# Altium schematic sheet MOSFET-Motor-Sheet-3.SchDoc
size 420 x 297 mm; SheetNumber: 11; SheetTotal: 15
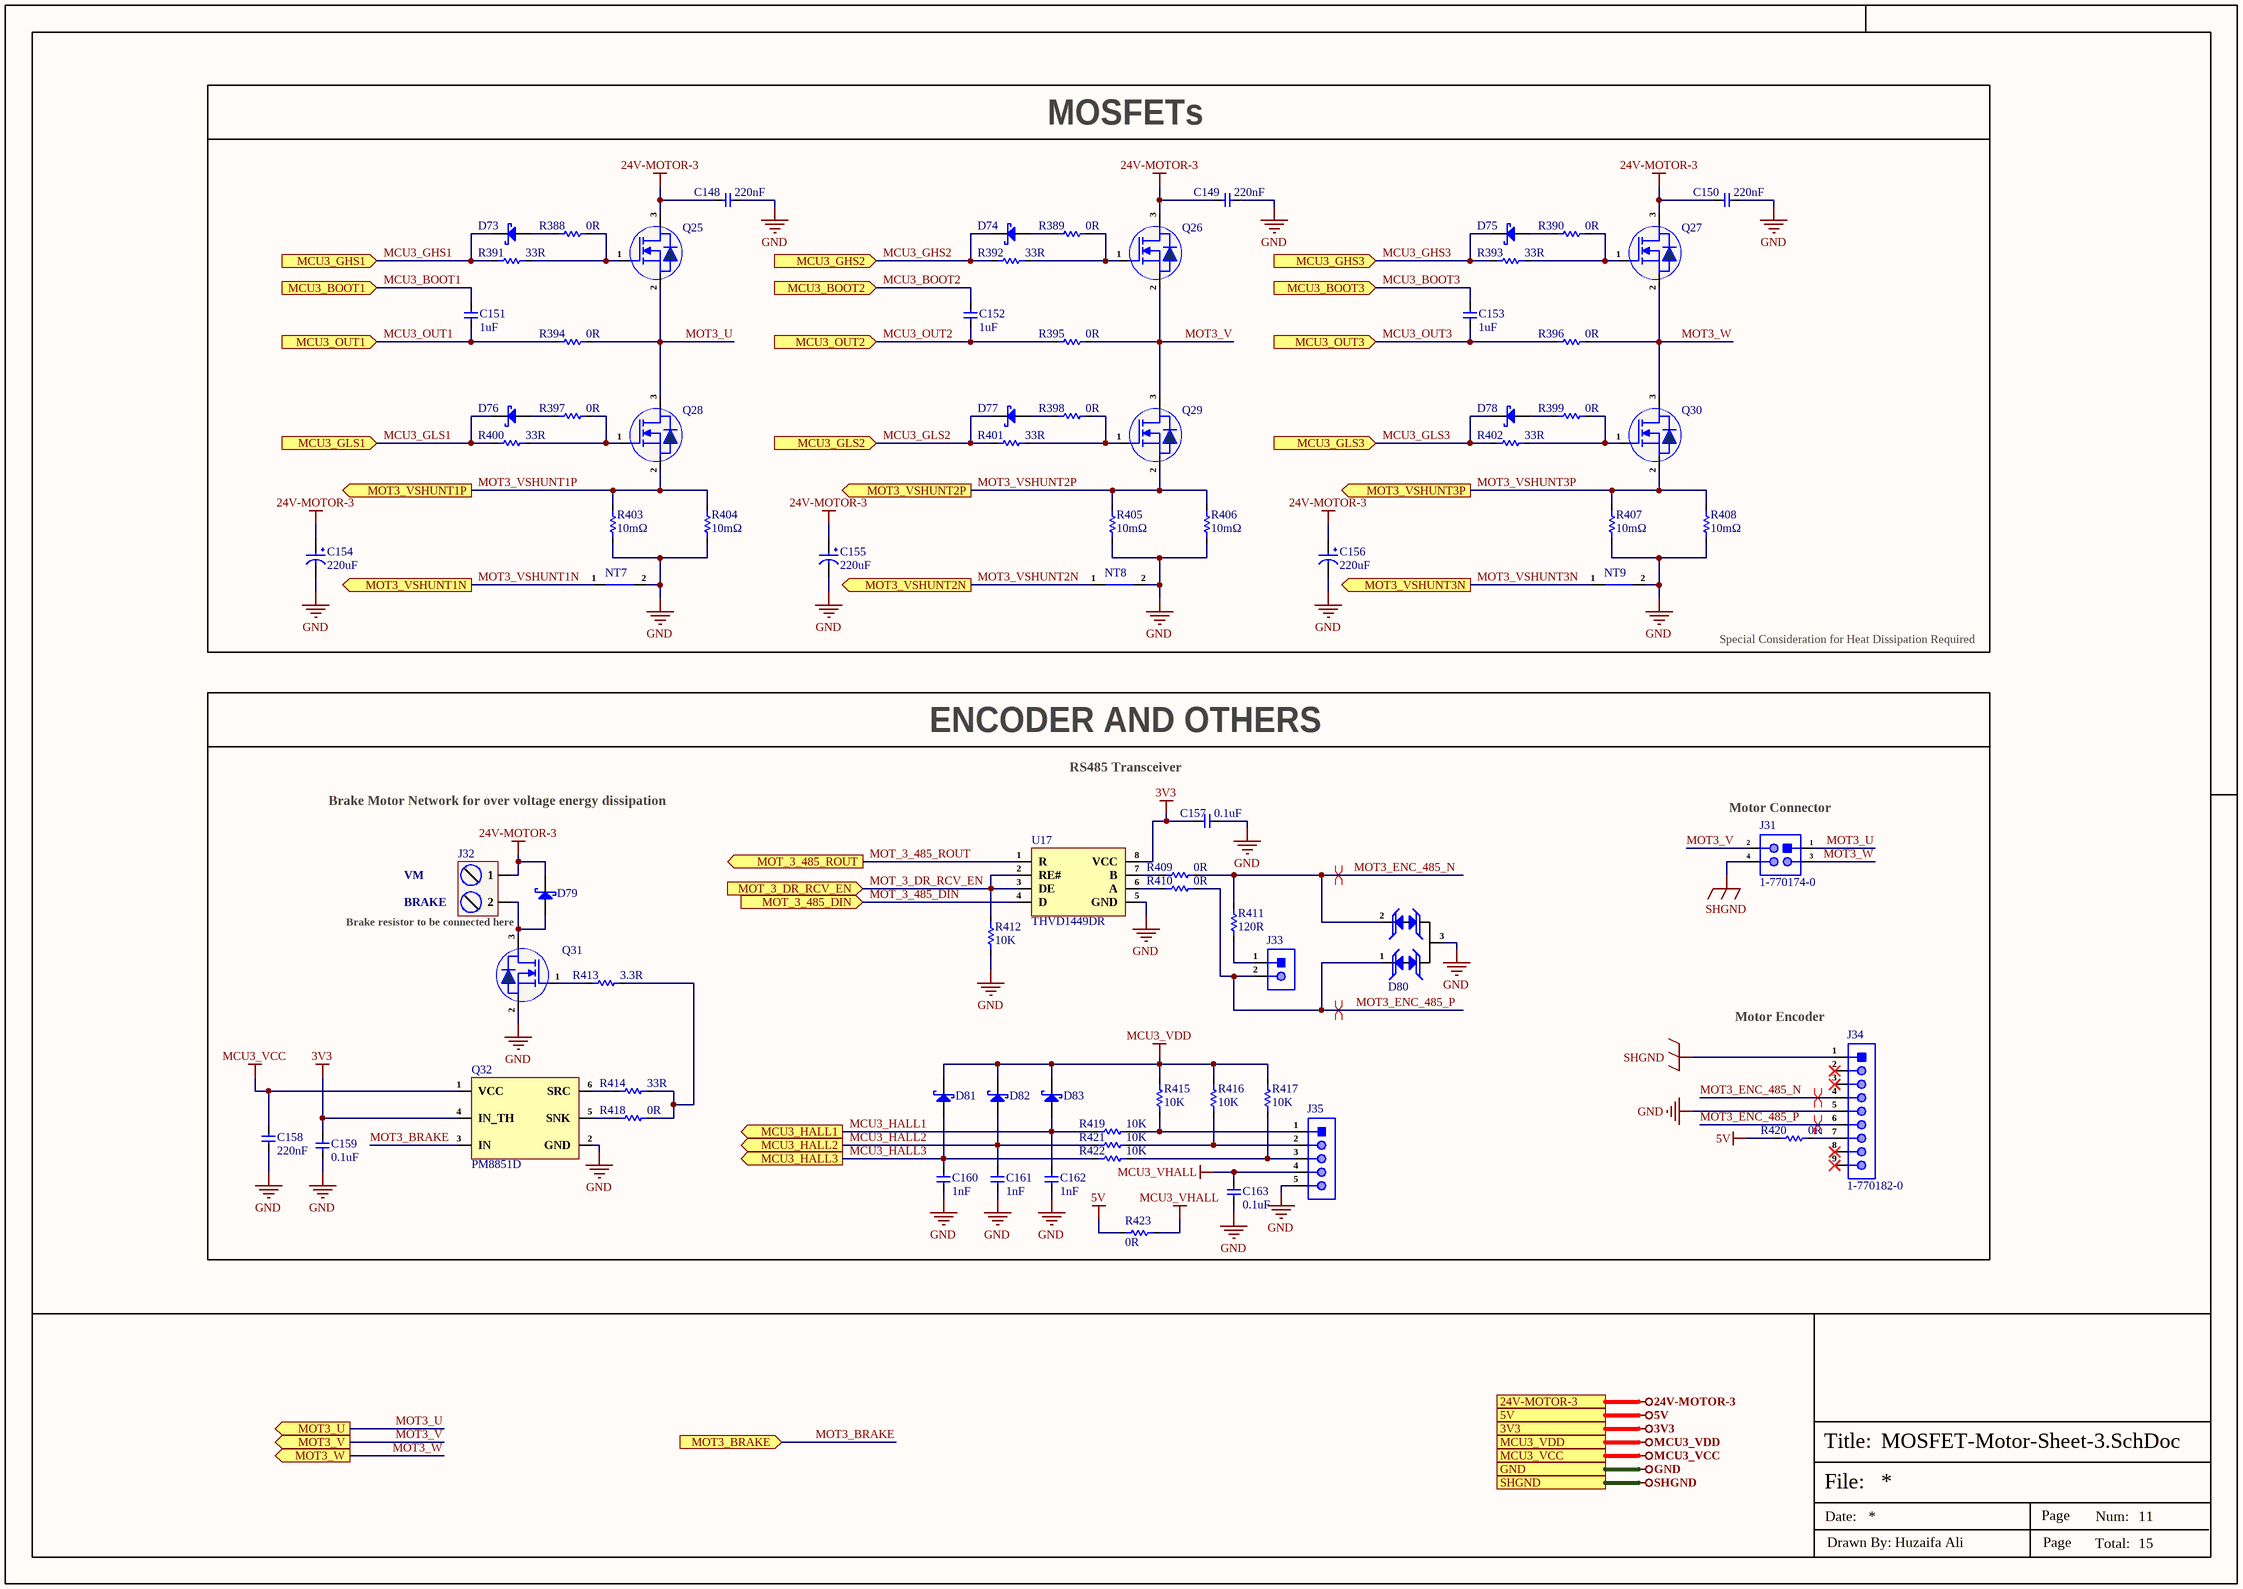
[diagram p0: MOSFET-Motor-Sheet-3.SchDoc]

## Parts
C148  220nF  [Cap-0805]
C149  220nF  [Cap-0805]
C150  220nF  [Cap-0805]
C151  1uF  [Cap-0603]
C152  1uF  [Cap-0603]
C153  1uF  [Cap-0603]
C154  220uF  [SPE1VM221E12OL]
C155  220uF  [SPE1VM221E12OL]
C156  220uF  [SPE1VM221E12OL]
C157  0.1uF  [Cap-0402]
C158  220nF  [Cap-0402]
C159  0.1uF  [Cap-0402]
C160  1nF  [Cap-0402]
C161  1nF  [Cap-0402]
C162  1nF  [Cap-0402]
C163  0.1uF  [Cap-0402]
D73  BAT48JFILM  [SOD-323]  (value not drawn)
D74  BAT48JFILM  [SOD-323]  (value not drawn)
D75  BAT48JFILM  [SOD-323]  (value not drawn)
D76  BAT48JFILM  [SOD-323]  (value not drawn)
D77  BAT48JFILM  [SOD-323]  (value not drawn)
D78  BAT48JFILM  [SOD-323]  (value not drawn)
D79  STPS3H100UF  [SMB_]  (value not drawn)
D80  SM712  [SOT-23]  (value not drawn)
D81  BAT30KFILM  [SOD-523]  (value not drawn)
D82  BAT30KFILM  [SOD-523]  (value not drawn)
D83  BAT30KFILM  [SOD-523]  (value not drawn)
J31  1-770174-0  [1-770174-0]
J32  DB128L-5.08-2P-BK-S  [DB128L-5.08-2P-BK-S]  (value not drawn)
J33  X6511WV-02H-C60D30  [HDR1X2_]  (value not drawn)
J34  1-770182-0  [1-770182-0]
J35  X6511WV-05H-C60D30  [HDR1X5_]  (value not drawn)
NT7  Net Tie_SMD  [Net Tie Pad]  (value not drawn)  (net tie, no BOM)
NT8  Net Tie_SMD  [Net Tie Pad]  (value not drawn)  (net tie, no BOM)
NT9  Net Tie_SMD  [Net Tie Pad]  (value not drawn)  (net tie, no BOM)
Q25  STH240N10F7-2  [H2PAK-2]  (value not drawn)
Q26  STH240N10F7-2  [H2PAK-2]  (value not drawn)
Q27  STH240N10F7-2  [H2PAK-2]  (value not drawn)
Q28  STH240N10F7-2  [H2PAK-2]  (value not drawn)
Q29  STH240N10F7-2  [H2PAK-2]  (value not drawn)
Q30  STH240N10F7-2  [H2PAK-2]  (value not drawn)
Q31  STH240N10F7-2  [H2PAK-2]  (value not drawn)
Q32  PM8851D  [SOT-23-6]
R388  0R  [Res-0805]
R389  0R  [Res-0805]
R390  0R  [Res-0805]
R391  33R  [Res-0402]
R392  33R  [Res-0402]
R393  33R  [Res-0402]
R394  0R  [Res-0805]
R395  0R  [Res-0805]
R396  0R  [Res-0805]
R397  0R  [Res-0805]
R398  0R  [Res-0805]
R399  0R  [Res-0805]
R400  33R  [Res-0402]
R401  33R  [Res-0402]
R402  33R  [Res-0402]
R403  10mΩ  [RES-2512]
R404  10mΩ  [RES-2512]
R405  10mΩ  [RES-2512]
R406  10mΩ  [RES-2512]
R407  10mΩ  [RES-2512]
R408  10mΩ  [RES-2512]
R409  0R  [Res-0402]
R410  0R  [Res-0402]
R411  120R  [Res-0603]
R412  10K  [Res-0402]
R413  3.3R  [Res-0402]
R414  33R  [Res-0402]
R415  10K  [Res-0402]
R416  10K  [Res-0402]
R417  10K  [Res-0402]
R418  0R  [Res-0805]
R419  10K  [Res-0402]
R420  0R  [Res-0402]
R421  10K  [Res-0402]
R422  10K  [Res-0402]
R423  0R  [Res-0805]
U17  THVD1449DR  [SOIC-8(0.154", 3.90mm Width)]

## Blocks framed on the sheet
MOSFETs: C148-C156 D73-D78 NT7-NT9 Q25-Q30 R388-R408
ENCODER AND OTHERS: C157-C163 D79-D83 J31-J35 Q31 Q32 R409-R423 U17

## Ports
3V3, 5V, 24V-MOTOR-3, GND, MCU3_BOOT1 (in), MCU3_BOOT2 (in), MCU3_BOOT3 (in), MCU3_GHS1 (in), MCU3_GHS2 (in), MCU3_GHS3 (in), MCU3_GLS1 (in), MCU3_GLS2 (in), MCU3_GLS3 (in), MCU3_HALL1 (out), MCU3_HALL2 (out), MCU3_HALL3 (out), MCU3_OUT1 (in), MCU3_OUT2 (in), MCU3_OUT3 (in), MCU3_VCC, MCU3_VDD, MOT3_BRAKE (in), MOT3_U (out), MOT3_V (out), MOT3_VSHUNT1N (out), MOT3_VSHUNT1P (out), MOT3_VSHUNT2N (out), MOT3_VSHUNT2P (out), MOT3_VSHUNT3N (out), MOT3_VSHUNT3P (out), MOT3_W (out), MOT_3_485_DIN (in), MOT_3_485_ROUT (out), MOT_3_DR_RCV_EN (in), SHGND

## Nets
3V3: C157.2 C159.2 Q32.4(IN_TH) U17.8(VCC) ; port 3V3
5V: R420.1 R423.1 ; port 5V
24V-MOTOR-3: C148.2 C149.2 C150.2 C154.1 C155.1 C156.1 D79.2(K) J32.1 Q25.3(D) Q26.3(D) Q27.3(D) ; port 24V-MOTOR-3
GND: C148.1 C149.1 C150.1 C154.2 C155.2 C156.2 C157.1 C158.1 C159.1 C160.1 C161.1 C162.1 C163.2 D80.3(GND) J34.5 J35.5 NT7.2 NT8.2 NT9.2 Q31.2(S) Q32.2(GND) R403.1 R404.1 R405.1 R406.1 R407.1 R408.1 R412.2 U17.5(GND) ; port GND
MCU3_VCC: C158.2 Q32.1(VCC) ; port MCU3_VCC
MCU3_VDD: D81.2(K) D82.2(K) D83.2(K) R415.2 R416.2 R417.2 ; port MCU3_VDD
MCU3_VHALL: C163.1 J35.4 R423.2
SHGND: J31.4 J34.1 ; port SHGND
MCU3_BOOT1: C151.2 ; port MCU3_BOOT1
MCU3_BOOT2: C152.2 ; port MCU3_BOOT2
MCU3_BOOT3: C153.2 ; port MCU3_BOOT3
MCU3_GHS1: D73.1(K) R391.1 ; port MCU3_GHS1
MCU3_GHS2: D74.1(K) R392.1 ; port MCU3_GHS2
MCU3_GHS3: D75.1(K) R393.1 ; port MCU3_GHS3
MCU3_GLS1: D76.1(K) R400.1 ; port MCU3_GLS1
MCU3_GLS2: D77.1(K) R401.1 ; port MCU3_GLS2
MCU3_GLS3: D78.1(K) R402.1 ; port MCU3_GLS3
MCU3_HALL1: C162.2 D83.1(A) R419.1 ; port MCU3_HALL1
MCU3_HALL2: C161.2 D82.1(A) R421.1 ; port MCU3_HALL2
MCU3_HALL3: C160.2 D81.1(A) R422.1 ; port MCU3_HALL3
MCU3_OUT1: C151.1 R394.1 ; port MCU3_OUT1
MCU3_OUT2: C152.1 R395.1 ; port MCU3_OUT2
MCU3_OUT3: C153.1 R396.1 ; port MCU3_OUT3
MOT3_BRAKE: Q32.3(IN) ; port MOT3_BRAKE
MOT3_ENC_485_N: D80.2(I/O2) J34.4 R409.2 R411.2
MOT3_ENC_485_P: D80.1(I/O1) J33.2 J34.6 R410.2
MOT3_U: J31.1 Q25.2(S) Q28.3(D) R394.2 ; port MOT3_U
MOT3_V: J31.2 Q26.2(S) Q29.3(D) R395.2 ; port MOT3_V
MOT3_VSHUNT1N: NT7.1 ; port MOT3_VSHUNT1N
MOT3_VSHUNT1P: Q28.2(S) R403.2 R404.2 ; port MOT3_VSHUNT1P
MOT3_VSHUNT2N: NT8.1 ; port MOT3_VSHUNT2N
MOT3_VSHUNT2P: Q29.2(S) R405.2 R406.2 ; port MOT3_VSHUNT2P
MOT3_VSHUNT3N: NT9.1 ; port MOT3_VSHUNT3N
MOT3_VSHUNT3P: Q30.2(S) R407.2 R408.2 ; port MOT3_VSHUNT3P
MOT3_W: J31.3 Q27.2(S) Q30.3(D) R396.2 ; port MOT3_W
MOT_3_485_DIN: U17.4(D) ; port MOT_3_485_DIN
MOT_3_485_ROUT: U17.1(R) ; port MOT_3_485_ROUT
MOT_3_DR_RCV_EN: R412.1 U17.2(RE#) U17.3(DE) ; port MOT_3_DR_RCV_EN
NetD73_2: D73.2(A) R388.1
NetD74_2: D74.2(A) R389.1
NetD75_2: D75.2(A) R390.1
NetD76_2: D76.2(A) R397.1
NetD77_2: D77.2(A) R398.1
NetD78_2: D78.2(A) R399.1
NetD79_1: D79.1(A) J32.2 Q31.3(D)
NetJ33_1: J33.1 R411.1
NetJ34_7: J34.7 R420.2
NetJ35_1: J35.1 R415.1 R419.2
NetJ35_2: J35.2 R416.1 R421.2
NetJ35_3: J35.3 R417.1 R422.2
NetQ25_1: Q25.1(G) R388.2 R391.2
NetQ26_1: Q26.1(G) R389.2 R392.2
NetQ27_1: Q27.1(G) R390.2 R393.2
NetQ28_1: Q28.1(G) R397.2 R400.2
NetQ29_1: Q29.1(G) R398.2 R401.2
NetQ30_1: Q30.1(G) R399.2 R402.2
NetQ31_1: Q31.1(G) R413.1
NetQ32_5: Q32.5(SNK) R418.1
NetQ32_6: Q32.6(SRC) R414.1
NetR409_1: R409.1 U17.7(B)
NetR410_1: R410.1 U17.6(A)
NetR413_2: R413.2 R414.2 R418.2

Not connected (* = marked no-connect by the designer): J34 2* 3* 8* 9*

## Layout directives
differential pair: MOT3_ENC_485_N, MOT3_ENC_485_P
differential pair; differential pair class DIFF_RS485: MOT3_ENC_485_N, MOT3_ENC_485_P

## Notes on the sheet
- Special Consideration for Heat Dissipation Required
- Brake Motor Network for over voltage energy dissipation
- (near C157) RS485 Transceiver
- (near J31) Motor Connector
- VM
- BRAKE
- Brake resistor to be connected here
- (near J34) Motor Encoder
- File:
- Title:
- Date:
- Page
- Num:
- Total:
- Drawn By: Huzaifa Ali

## Library data of the parts
C148-C150 = CC0805KKX7R0BB224: CAP CER 0.22UF 100V X7R 0805; Manufacturer: Yageo; Item Type: Capacitor; Tolerance: 10%; Supplier: Future Electronics; LCSC Part Number: C513710; Manufacturer Part Number: CC0805KKX7R0BB224; RoHS: Yes; Stock: 123000; Pricing: 3000=0.0385, 9000=0.0376, 15000=0.0372, 60000=0.0361, 90000=0.0353 (USD); Mounting Technology: Surface Mount; Case/Package: 0805; Case Code (Metric): 2012; Case Code (Imperial): 0805; Weight: 0.000194oz; Min Operating Temperature: -55°C; Max Operating Temperature: 125°C; Packaging: Tape and Reel; Value: 220nF; Voltage Rating: 100V; Dielectric: X7R; Termination: SMD/SMT; Voltage Rating (DC): 100V; Package Quantity: 3000; Series: CC; Length: 2mm; Width: 1.25mm; RoHS Compliant: Yes; ComponentLink1URL: https://media.digikey.com/pdf/Data%20Sheets/Yageo%20PDFs/NPO,%20X7R%20Mid-voltage.pdf?src-supplier=Digikey; ComponentLink1Description: https://media.digikey.com/pdf/Data%20Sheets/Yageo%20PDFs/NPO,%20X7R%20Mid-voltage.pdf?src-supplier=Digikey; ComponentLink2URL: http://www.mouser.com/ds/2/447/Yageo_UPY-GP_NP0_16V-to-50V_9-358835.pdf?src-supplier=Mouser; ComponentLink2Description: http://www.mouser.com/ds/2/447/Yageo_UPY-GP_NP0_16V-to-50V_9-358835.pdf?src-supplier=Mouser; ComponentLink3URL: https://datasheet.octopart.com/CC0805KKX7R0BB224-Yageo-datasheet-137700083.pdf?src-supplier=Future+Electronics; ComponentLink3Description: https://datasheet.octopart.com/CC0805KKX7R0BB224-Yageo-datasheet-137700083.pdf?src-supplier=Future+Electronics; ComponentLink4URL: http://www.yageo.com/documents/recent/UPY-NP0X7R_MV_100-to-630V_21.pdf?src-supplier=Digikey; ComponentLink4Description: http://www.yageo.com/documents/recent/UPY-NP0X7R_MV_100-to-630V_21.pdf?src-supplier=Digikey; ComponentLink5URL: https://datasheet.octopart.com/CC0805KKX7R0BB224-Yageo-datasheet-166511530.pdf?src-supplier=Future+Electronics; ComponentLink5Description: https://datasheet.octopart.com/CC0805KKX7R0BB224-Yageo-datasheet-166511530.pdf?src-supplier=Future+Electronics; ComponentLink6URL: https://datasheet.octopart.com/CC0805KKX7R0BB224-Yageo-datasheet-101324229.pdf?src-supplier=Newark; ComponentLink6Description: https://datasheet.octopart.com/CC0805KKX7R0BB224-Yageo-datasheet-101324229.pdf?src-supplier=Newark
C151-C153 = CL10A105KB8NNNC: CAP CER 1UF 50V X5R 0603; Manufacturer: Samsung; Material: 4241ConductorMaterial; Tolerance: 10%; Item Type: Capacitor; Supplier: Avnet; Supplier Part Number: CL10A105KB8NNNC; Manufacturer Part Number: CL10A105KB8NNNC; RoHS: Yes; Category: Ceramic Capacitors; Stock: 780446; Pricing: 4000=0.01632, 8000=0.01595, 16000=0.01557, 24000=0.0152, 32000=0.01482 (USD); Mounting Technology: Surface Mount; Case/Package: 0603; Case Code (Metric): 1608; Case Code (Imperial): 0603; Min Operating Temperature: -55°C; Max Operating Temperature: 85°C; Packaging: Tape and Reel; Value: 1uF; Voltage Rating: 50V; Dielectric: X5R; Series: CL; Voltage Rating (DC): 50V; Length: 1.6mm; Depth: 0.8mm; Radiation Hardening: No; RoHS Compliant: Yes; ComponentLink1URL: https://datasheet.ciiva.com/26877/getdatasheetpartid-753736-26877879.pdf?src-supplier=Verical; ComponentLink1Description: https://datasheet.ciiva.com/26877/getdatasheetpartid-753736-26877879.pdf?src-supplier=Verical; LCSC Part Number: C15849
C154-C156 = SPE1VM221E12OL: 35V 220uF ±20% Plugin,D6.3xL12mm Polymer Aluminum Capacitors ROHS; Manufacturer: Yunxing; Manufacturer Part Number: SPE1VM221E12OL; Package: Plugin,D6.3xL12mm; LCSC Part Number: C698133; Item Type: Capacitor; ComponentLink1Description: LCSC; ComponentLink1URL: https://www.lcsc.com/product-detail/Polymer-Aluminum-Capacitors_Yunxing-SPE1VM221E12OL_C698133.html?s_z=n_SPE1VM221E12OL
C157 C159 C163 = CC0402JRX7R7BB104: CAP CER 0.1UF 16V X7R 0402; Manufacturer: Yageo; Material: 4241ConductorMaterial; Value: 100nF; Tolerance: 5%; Item Type: Capacitor; Supplier: Digikey; Supplier Part Number: 311-1676-1-ND; Manufacturer Part Number: CC0402JRX7R7BB104; RoHS: Yes; Category: Ceramic Capacitors; Stock: 1659111; Pricing: 1=0.1, 10=0.046, 50=0.0262, 100=0.0203, 500=0.01528, 1000=0.012, 2500=0.01091, 5000=0.01004 (USD); Mounting Technology: Surface Mount; Case/Package: 0402; Case Code (Metric): 1005; Case Code (Imperial): 0402; Min Operating Temperature: -55°C; Max Operating Temperature: 125°C; Dielectric: X7R; Packaging: Tape and Reel; Package Quantity: 10000; Voltage Rating (DC): 16V; Voltage Rating: 16V; Series: CC; Construction: Flat; Length: 0.039inch; Width: 0.02inch; Height: 0.5mm; Thickness: 0.022inch; Lead Free: Lead Free; Halogen Free: Halogen Free; RoHS Compliant: Yes; ComponentLink1URL: https://datasheet.ciiva.com/13210/upy-gphc-x7r-6-3v-to-50v-8-12304-13210152.pdf?src-supplier=Mouser; ComponentLink1Description: https://datasheet.ciiva.com/13210/upy-gphc-x7r-6-3v-to-50v-8-12304-13210152.pdf?src-supplier=Mouser; LCSC Part Number: C541464
C158 = CC0402KRX5R8BB224: CAP CER 0.22UF 25V X5R 0402; Manufacturer: Yageo; Item Type: Capacitors; Tolerance: 10%; Supplier 1: Mouser; Manufacturer Part Number: CC0402KRX5R8BB224; RoHS: Yes; Stock 1: 61266; Pricing 1: 1=0.10000, 10=0.03300, 50=0.03300, 100=0.02700, 1000=0.01500, 10000=0.01300 (USD); Mount: Surface Mount; Case/Package: 0402; Min Operating Temperature: -55°C; Max Operating Temperature: 85°C; Packaging: Tape and Reel; Capacitance: 220nF; Voltage Rating: 25V; Voltage Rating (DC): 25V; Dielectric: X5R; Length: 0.039inch; Width: 0.02inch; Thickness: 0.022inch; Lead Free: Lead Free; Halogen Free: Halogen Free; RoHS Compliant: Yes; ComponentLink1URL: http://www.yageo.com/documents/recent/UPY-GPHC_X5R_4V-to-50V_25.pdf?src-supplier=Digi-Key; ComponentLink1Description: http://www.yageo.com/documents/recent/UPY-GPHC_X5R_4V-to-50V_25.pdf?src-supplier=Digi-Key; ComponentLink2URL: https://www.yageo.com/upload/media/product/productsearch/datasheet/mlcc/UPY-GPHC_X5R_4V-to-50V_26.pdf?src-supplier=Digi-Key; ComponentLink2Description: https://www.yageo.com/upload/media/product/productsearch/datasheet/mlcc/UPY-GPHC_X5R_4V-to-50V_26.pdf?src-supplier=Digi-Key; ComponentLink3URL: http://www.yageo.com/documents/recent/UPY-GPHC_X5R_4V-to-50V_23.pdf?src-supplier=Digi-Key; ComponentLink3Description: http://www.yageo.com/documents/recent/UPY-GPHC_X5R_4V-to-50V_23.pdf?src-supplier=Digi-Key; Supplier Part Number 1: 603-CC402KRX5R8BB224; LCSC Part Number: C326836
C160-C162 = CC0402KRX7R8BB102: CAP CER 1000PF 25V X7R 0402; Manufacturer: Yageo; Tolerance: 10%; Dissipation Factor: 2.5%; Insulation Resistance: 10GR; Item Type: Capacitor; Supplier 1: Arrow Electronics; Manufacturer Part Number: CC0402KRX7R8BB102; RoHS: Yes; Category: Ceramic Capacitors; Stock 1: 370000; Pricing 1: 1=0.00230, 10000=0.00230, 100001=0.00190 (USD); Mount: Surface Mount; Case/Package: 0402; Number of Pins: 2; Case Code (Imperial): 0402; Case Code (Metric): 1005; Min Operating Temperature: -55°C; Max Operating Temperature: 125°C; Capacitance: 1nF; Packaging: Tape and Reel; Voltage Rating: 25V; Dielectric: X7R; Termination: SMD/SMT; Voltage Rating (DC): 25V; Series: CC; Length: 1mm; Width: 0.02inch; Thickness: 0.022inch; Depth: 0.5mm; Radiation Hardening: No; Lead Free: Lead Free; Halogen Free: Halogen Free; RoHS Compliant: Yes; ComponentLink1URL: https://datasheet.ciiva.com/26862/getdatasheetpartid-639817-26862638.pdf?src-supplier=Verical; ComponentLink1Description: https://datasheet.ciiva.com/26862/getdatasheetpartid-639817-26862638.pdf?src-supplier=Verical; ComponentLink2URL: https://datasheet.ciiva.com/5425/upy-gp-np0-16v-to-50v-8-3714-5425527.pdf?src-supplier=Mouser; ComponentLink2Description: https://datasheet.ciiva.com/5425/upy-gp-np0-16v-to-50v-8-3714-5425527.pdf?src-supplier=Mouser; Supplier Part Number 1: CC0402KRX7R8BB102; LCSC Part Number: C541372
D73-D78 = BAT48JFILM: DIODE SCHOTTKY 40V 350MA SOD323; Manufacturer: STMicroelectronics; Supplier: Future Electronics; LCSC Part Number: C2798199; Manufacturer Part Number: BAT48JFILM; RoHS: Yes; Item Type: Diode; Stock: 21000; Pricing: 3000=0.0329, 9000=0.0316, 15000=0.031, 30000=0.0303, 60000=0.0291 (USD); ComponentLink1URL: https://datasheet.ciiva.com/23920/1449576-23920129.pdf?src-supplier=Newark; ComponentLink1Description: https://datasheet.ciiva.com/23920/1449576-23920129.pdf?src-supplier=Newark; ComponentLink2URL: https://datasheet.ciiva.com/4714/cd00130229-113731-4714649.pdf?src-supplier=Mouser; ComponentLink2Description: https://datasheet.ciiva.com/4714/cd00130229-113731-4714649.pdf?src-supplier=Mouser; ComponentLink3URL: https://datasheet.ciiva.com/915/cd00130229-915689.pdf?src-supplier=Digikey; ComponentLink3Description: https://datasheet.ciiva.com/915/cd00130229-915689.pdf?src-supplier=Digikey; ComponentLink4URL: https://datasheet.ciiva.com/915/cd00130229-915690.pdf?src-supplier=Digikey; ComponentLink4Description: https://datasheet.ciiva.com/915/cd00130229-915690.pdf?src-supplier=Digikey; ComponentLink5URL: https://datasheet.ciiva.com/915/cd00130229-915691.pdf?src-supplier=Digikey; ComponentLink5Description: https://datasheet.ciiva.com/915/cd00130229-915691.pdf?src-supplier=Digikey; ComponentLink6URL: https://datasheet.ciiva.com/16206/cd00130229-16206668.pdf?src-supplier=Future+Electronics; ComponentLink6Description: https://datasheet.ciiva.com/16206/cd00130229-16206668.pdf?src-supplier=Future+Electronics
D79 = STPS3H100UF: DIODE SCHOTTKY 100V 3A SMBFLAT; Manufacturer: STMicroelectronics; Supplier: Mouser; LCSC Part Number: C155643; Manufacturer Part Number: STPS3H100UF; RoHS: Yes; Item Type: Diode; Stock: 122842; Pricing: 1=0.35, 10=0.257, 50=0.257, 100=0.213, 1000=0.143, 10000=0.103 (USD); Lead Free: 5697LeadFree; RoHS Compliant: 5897YesNo; ComponentLink1URL: https://datasheet.ciiva.com/4716/cd00256107-65241-4716262.pdf?src-supplier=Mouser; ComponentLink1Description: https://datasheet.ciiva.com/4716/cd00256107-65241-4716262.pdf?src-supplier=Mouser; ComponentLink2URL: https://datasheet.ciiva.com/915/cd00256107-915837.pdf?src-supplier=Digikey; ComponentLink2Description: https://datasheet.ciiva.com/915/cd00256107-915837.pdf?src-supplier=Digikey; ComponentLink3URL: https://datasheet.ciiva.com/915/cd00256107-915838.pdf?src-supplier=Digikey; ComponentLink3Description: https://datasheet.ciiva.com/915/cd00256107-915838.pdf?src-supplier=Digikey; ComponentLink4URL: https://datasheet.ciiva.com/915/cd00256107-915839.pdf?src-supplier=Digikey; ComponentLink4Description: https://datasheet.ciiva.com/915/cd00256107-915839.pdf?src-supplier=Digikey; ComponentLink5URL: https://datasheet.ciiva.com/16491/cd00256107-16491518.pdf?src-supplier=Future+Electronics; ComponentLink5Description: https://datasheet.ciiva.com/16491/cd00256107-16491518.pdf?src-supplier=Future+Electronics
D80 = SM712: SOT-23 TVS ROHS; Manufacturer: TECH PUBLIC; Item Type: Diode; Manufacturer Part Number: SM712; Package: SOT-23; LCSC Part Number: C521963; ComponentLink1Description: LCSC; ComponentLink1URL: https://www.lcsc.com/product-detail/TVS_TECH-PUBLIC-SM712_C521963.html
D81-D83 = BAT30KFILM: DIODE SCHOTTKY 30V 300MA SOD523; Manufacturer: STMicroelectronics; Supplier: Digikey; LCSC Part Number: C2926449; Manufacturer Part Number: BAT30KFILM; RoHS: Yes; Item Type: Diode; Stock: 129643; Pricing: 1=0.33, 10=0.204, 100=0.1279, 500=0.09468, 1000=0.08393 (USD); ComponentLink1URL: https://datasheet.ciiva.com/15192/getdatasheetpartid-146449-15192970.pdf?src-supplier=Verical; ComponentLink1Description: https://datasheet.ciiva.com/15192/getdatasheetpartid-146449-15192970.pdf?src-supplier=Verical; ComponentLink2URL: https://datasheet.ciiva.com/16418/cd00126118-16418392.pdf?src-supplier=Future+Electronics; ComponentLink2Description: https://datasheet.ciiva.com/16418/cd00126118-16418392.pdf?src-supplier=Future+Electronics; ComponentLink3URL: https://datasheet.ciiva.com/915/cd00126118-915601.pdf?src-supplier=Digikey; ComponentLink3Description: https://datasheet.ciiva.com/915/cd00126118-915601.pdf?src-supplier=Digikey; ComponentLink4URL: https://datasheet.ciiva.com/915/cd00126118-915602.pdf?src-supplier=Digikey; ComponentLink4Description: https://datasheet.ciiva.com/915/cd00126118-915602.pdf?src-supplier=Digikey; ComponentLink5URL: https://datasheet.ciiva.com/915/cd00126118-915603.pdf?src-supplier=Digikey; ComponentLink5Description: https://datasheet.ciiva.com/915/cd00126118-915603.pdf?src-supplier=Digikey
J31 = 1-770174-0: CONN HEADER VERT 4POS 4.14MM; Manufacturer: TE Connectivity; Item Type: Power Connectors; Supplier: Future Electronics; Supplier Part Number: 3310547; Manufacturer Part Number: 1-770174-0; RoHS: Yes; Stock: 890; Pricing: 1=0.995, 30=1.04, 40=0.945, 125=0.91, 300=0.95, 400=0.87, 1250=0.8 (USD); ComponentLink1URL: https://datasheet.ciiva.com/19460/746478-19460823.pdf?src-supplier=Jameco; ComponentLink1Description: https://datasheet.ciiva.com/19460/746478-19460823.pdf?src-supplier=Jameco; ComponentLink2URL: https://datasheet.ciiva.com/11755/0900766b80b8608c-11755178.pdf?src-supplier=Rs; ComponentLink2Description: https://datasheet.ciiva.com/11755/0900766b80b8608c-11755178.pdf?src-supplier=Rs; ComponentLink3URL: https://datasheet.ciiva.com/16324/eng-cs-82181-softshell-high-density-0508-16324224.pdf?src-supplier=Future+Electronics; ComponentLink3Description: https://datasheet.ciiva.com/16324/eng-cs-82181-softshell-high-density-0508-16324224.pdf?src-supplier=Future+Electronics; ComponentLink4URL: https://datasheet.ciiva.com/1111/eng-cd-770174-l2-1111782.pdf?src-supplier=Element14; ComponentLink4Description: https://datasheet.ciiva.com/1111/eng-cd-770174-l2-1111782.pdf?src-supplier=Element14; ComponentLink5URL: https://datasheet.ciiva.com/15173/getdatasheetpartid-47574-15173655.pdf?src-supplier=Verical; ComponentLink5Description: https://datasheet.ciiva.com/15173/getdatasheetpartid-47574-15173655.pdf?src-supplier=Verical; ComponentLink6URL: https://datasheet.ciiva.com/710/eng-cd-770174-m-710026.pdf?src-supplier=Digikey; ComponentLink6Description: https://datasheet.ciiva.com/710/eng-cd-770174-m-710026.pdf?src-supplier=Digikey; ComponentLink7URL: https://datasheet.ciiva.com/3126/eng-cs-82181-softshell-high-density-0408-3126092.pdf?src-supplier=Avnet; ComponentLink7Description: https://datasheet.ciiva.com/3126/eng-cs-82181-softshell-high-density-0408-3126092.pdf?src-supplier=Avnet; ComponentLink8URL: https://datasheet.ciiva.com/30189/eng-cs-82181-softshell-high-density-0508-30189644.pdf?src-supplier=Onlinecomponents.com; ComponentLink8Description: https://datasheet.ciiva.com/30189/eng-cs-82181-softshell-high-density-0508-30189644.pdf?src-supplier=Onlinecomponents.com; ComponentLink9URL: https://datasheet.ciiva.com/29266/745091-da-01-en-4-pol-mini-univ-mate-n-lok-stecksockel-29266107.pdf?src-supplier=Conrad; ComponentLink9Description: https://datasheet.ciiva.com/29266/745091-da-01-en-4-pol-mini-univ-mate-n-lok-stecksockel-29266107.pdf?src-supplier=Conrad
J32 = DB128L-5.08-2P-BK-S: 1x2P 18A -40℃~+105℃ 250V Black 12~30 Straight pin 5.08mm 2.5 1 2 Plugin,P=5.08mm Screw terminal ROHS; Manufacturer: DIBO; Item Type: Terminal Block; Manufacturer Part Number: DB128L-5.08-2P-BK-S; Package: Plugin,P=5.08mm; LCSC Part Number: C430601; ComponentLink1Description: LCSC; ComponentLink1URL: https://www.lcsc.com/product-detail/Screw-terminal_span-style-background-color-ff0-DIBO-span-DB128L-5-08-2P-BK-S_C430601.html
J33 = X6511WV-02H-C60D30: Gold 250V 3A Straight Square Pins 2.5mm 2P 260℃ 6mm -40℃~+105℃ 3mm 2.54mm Plugin Black Brass 1x2P Plugin,P=2.54mm Pin Headers ROHS; Manufacturer: XKB; Item Type: Male Header; Manufacturer Part Number: X6511WV-02H-C60D30; Package: Plugin,P=2.54mm; LCSC Part Number: C706874; ComponentLink1Description: LCSC; ComponentLink1URL: https://www.lcsc.com/product-detail/Pin-Headers_XKB-Connectivity-X6511WV-02H-C60D30_C706874.html
J34 = 1-770182-0: CONN HEADER VERT 9POS 4.14MM; Manufacturer: TE Connectivity; Item Type: Power Connectors; Supplier: Future Electronics; LCSC Part Number: C3151769; Manufacturer Part Number: 1-770182-0; RoHS: Yes; Stock: 4602; Pricing: 1=1.17, 30=1.14, 125=1.1, 300=1.08, 1250=1.03 (USD); ComponentLink1URL: https://datasheet.ciiva.com/714/eng-cd-770182-l1-714801.pdf?src-supplier=Farnell; ComponentLink1Description: https://datasheet.ciiva.com/714/eng-cd-770182-l1-714801.pdf?src-supplier=Farnell; ComponentLink2URL: https://datasheet.ciiva.com/11755/0900766b80b8608c-11755213.pdf?src-supplier=Rs; ComponentLink2Description: https://datasheet.ciiva.com/11755/0900766b80b8608c-11755213.pdf?src-supplier=Rs; ComponentLink3URL: https://datasheet.ciiva.com/16222/eng-cs-82181-softshell-high-density-0508-16222388.pdf?src-supplier=Future+Electronics; ComponentLink3Description: https://datasheet.ciiva.com/16222/eng-cs-82181-softshell-high-density-0508-16222388.pdf?src-supplier=Future+Electronics; ComponentLink4URL: https://datasheet.ciiva.com/19460/892141-19460018.pdf?src-supplier=Jameco; ComponentLink4Description: https://datasheet.ciiva.com/19460/892141-19460018.pdf?src-supplier=Jameco; ComponentLink5URL: https://datasheet.ciiva.com/41446/001231547-da-01-en-stiftsockel-180grad-1-0770182-0-41446360.pdf?src-supplier=Conrad; ComponentLink5Description: https://datasheet.ciiva.com/41446/001231547-da-01-en-stiftsockel-180grad-1-0770182-0-41446360.pdf?src-supplier=Conrad; ComponentLink6URL: https://datasheet.ciiva.com/14154/770182-eng-datasheet-14154870.pdf?src-supplier=Distrelec; ComponentLink6Description: https://datasheet.ciiva.com/14154/770182-eng-datasheet-14154870.pdf?src-supplier=Distrelec; ComponentLink7URL: https://datasheet.ciiva.com/1111/1648474-1111785.pdf?src-supplier=Element14; ComponentLink7Description: https://datasheet.ciiva.com/1111/1648474-1111785.pdf?src-supplier=Element14; ComponentLink8URL: https://datasheet.ciiva.com/15173/getdatasheetpartid-92655-15173754.pdf?src-supplier=Verical; ComponentLink8Description: https://datasheet.ciiva.com/15173/getdatasheetpartid-92655-15173754.pdf?src-supplier=Verical; ComponentLink9URL: https://datasheet.ciiva.com/3126/eng-cs-82181-softshell-high-density-0408-3126095.pdf?src-supplier=Avnet; ComponentLink9Description: https://datasheet.ciiva.com/3126/eng-cs-82181-softshell-high-density-0408-3126095.pdf?src-supplier=Avnet; ComponentLink10URL: https://datasheet.ciiva.com/30155/eng-cs-82181-softshell-high-density-0508-30155467.pdf?src-supplier=Onlinecomponents.com; ComponentLink10Description: https://datasheet.ciiva.com/30155/eng-cs-82181-softshell-high-density-0508-30155467.pdf?src-supplier=Onlinecomponents.com
J35 = X6511WV-05H-C60D30: Gold 250V 3A Straight Square Pins 2.5mm 5P 260℃ 6mm -40℃~+105℃ 3mm 2.54mm Plugin Black Brass 1x5P Plugin,P=2.54mm Pin Headers ROHS; Manufacturer: XKB; Item Type: Male Header; ComponentLink1Description: LCSC; ComponentLink1URL: https://www.lcsc.com/product-detail/Pin-Headers_XKB-Connectivity-X6511WV-05H-C60D30_C706877.html; Manufacturer Part Number: X6511WV-05H-C60D30; Package: Plugin,P=2.54mm; LCSC Part Number: C706877
NT7-NT9 = Net Tie_SMD: Net Tie SMD; Manufacturer Part Number: Net Tie; Item Type: Net Tie Pad
Q25-Q31 = STH240N10F7-2: MOSFET N-CH 100V 180A H2PAK-2; Manufacturer: STMicroelectronics; Item Type: MOSFETs; Supplier: Mouser; LCSC Part Number: C3278109; Manufacturer Part Number: STH240N10F7-2; RoHS: Yes; Stock: 947; Pricing: 1=5.25, 10=5.25, 50=5.25, 100=5.25, 1000=1.89, 10000=1.89 (USD); ComponentLink1URL: http://www.mouser.com/ds/2/389/sth240n10f7-2-956094.pdf?src-supplier=Mouser; ComponentLink1Description: http://www.mouser.com/ds/2/389/sth240n10f7-2-956094.pdf?src-supplier=Mouser; ComponentLink2URL: http://www.st.com/content/ccc/resource/technical/document/datasheet/c0/bb/6e/12/19/24/43/41/DM00111318.pdf/files/DM00111318.pdf/jcr:content/translations/en.DM00111318.pdf?src-supplier=Digikey; ComponentLink2Description: http://www.st.com/content/ccc/resource/technical/document/datasheet/c0/bb/6e/12/19/24/43/41/DM00111318.pdf/files/DM00111318.pdf/jcr:content/translations/en.DM00111318.pdf?src-supplier=Digikey
Q32 = PM8851D: IC GATE DRVR LOW-SIDE SOT23-6; Manufacturer: STMicroelectronics; Supplier: Mouser; LCSC Part Number: C2971234; Manufacturer Part Number: PM8851D; RoHS: Yes; Stock: 15305; Pricing: 1=0.83, 10=0.537, 50=0.537, 100=0.44, 1000=0.405, 10000=0.341 (USD); ComponentLink1URL: http://www.st.com/content/ccc/resource/technical/document/datasheet/group3/2f/81/d0/59/c5/1d/48/68/DM00140981/files/DM00140981.pdf/jcr:content/translations/en.DM00140981.pdf?src-supplier=Digikey; ComponentLink1Description: http://www.st.com/content/ccc/resource/technical/document/datasheet/group3/2f/81/d0/59/c5/1d/48/68/DM00140981/files/DM00140981.pdf/jcr:content/translations/en.DM00140981.pdf?src-supplier=Digikey; ComponentLink2URL: http://www.st.com/st-web-ui/static/active/en/resource/technical/document/datasheet/DM00140981.pdf?src-supplier=Avnet; ComponentLink2Description: http://www.st.com/st-web-ui/static/active/en/resource/technical/document/datasheet/DM00140981.pdf?src-supplier=Avnet
R388-R390 R394-R399 R418 R423 = RC0805FR-070RL: RES 0 OHM JUMPER 1/8W 0805; Manufacturer: Yageo; Resistance: 0mR; Tolerance: 1%; Power Rating: 125mW; Item Type: Resistor; Supplier 1: Avnet; Manufacturer Part Number: RC0805FR-070RL; RoHS: Yes; Category: Chip SMD Resistors; Stock 1: 85000; Pricing 1: 5000=0.00281, 10000=0.00277, 20000=0.00269 (USD); Case/Package: 0805; Contact Plating: Tin,Matte; Case Code (Imperial): 0805; Case Code (Metric): 2012; Size Code: 0805; Min Operating Temperature: -55°C; Max Operating Temperature: 155°C; Resistor Type: Thick Film; Packaging: Tape and Reel; Features: Moisture Resistant; Series: RC; Max Power Dissipation: 125mW; Number of Terminations: 2; Construction: Rectangular; Length: 2mm; Depth: 1.25mm; Radiation Hardening: No; Military Standard: Not; Lead Free: Lead Free; RoHS Compliant: Yes; ComponentLink1URL: https://datasheet.ciiva.com/15189/getdatasheetpartid-348154-15189885.pdf?src-supplier=Verical; ComponentLink1Description: https://datasheet.ciiva.com/15189/getdatasheetpartid-348154-15189885.pdf?src-supplier=Verical; ComponentLink2URL: https://datasheet.ciiva.com/17042/rc0805-17042698.pdf?src-supplier=Future+Electronics; ComponentLink2Description: https://datasheet.ciiva.com/17042/rc0805-17042698.pdf?src-supplier=Future+Electronics; Supplier Part Number 1: RC0805FR-070RL; LCSC Part Number: C100045
R391-R393 R400-R402 R414 = RC0402FR-0733RL: RES 33 OHM 1% 1/16W 0402; Manufacturer: Yageo; Power Rating: 62.5mW; Voltage Rating: 50V; Temperature Coefficient: 100ppm/°C; Max Power Dissipation: 63mW; Supplier 1: Mouser; Manufacturer Part Number: RC0402FR-0733RL; RoHS: Yes; Category: Chip SMD Resistors; Stock 1: 1843488; Pricing 1: 1=0.10000, 10=0.01200, 50=0.01200, 100=0.00500, 1000=0.00300, 10000=0.00100 (USD); Case/Package: 0402; Number of Pins: 2; Case Code (Imperial): 0402; Case Code (Metric): 1005; Size Code: 0402; Min Operating Temperature: -55°C; Max Operating Temperature: 155°C; Resistor Type: Thick Film; Resistance: 33R; Tolerance: 1%; Packaging: Tape and Reel; Voltage Rating (DC): 50V; Package Quantity: 10000; Termination: SMD/SMT; Features: Moisture Resistant; Series: RC; Number of Terminations: 2; Resistance Tolerance: 1%; Construction: Rectangular; Technology: THICK FILM; Length: 1mm; Width: 0.5mm; Height: 0.35mm; Depth: 0.5mm; RoHS Compliant: Yes; REACH SVHC: Unknown; Military Standard: Not; Lead Free: Lead Free; ComponentLink1URL: https://datasheet.ciiva.com/11819/0900766b80c66297-11819487.pdf?src-supplier=RSComponents; ComponentLink1Description: https://datasheet.ciiva.com/11819/0900766b80c66297-11819487.pdf?src-supplier=RSComponents; ComponentLink2URL: https://datasheet.ciiva.com/24070/pyu-rc0402-51-rohs-l-6-r-8721-24070077.pdf?src-supplier=Mouser; ComponentLink2Description: https://datasheet.ciiva.com/24070/pyu-rc0402-51-rohs-l-6-r-8721-24070077.pdf?src-supplier=Mouser; ComponentLink3URL: https://datasheet.ciiva.com/7849/1018594-7849967.pdf?src-supplier=Element14; ComponentLink3Description: https://datasheet.ciiva.com/7849/1018594-7849967.pdf?src-supplier=Element14; ComponentLink4URL: https://datasheet.ciiva.com/7849/1018594-7849966.pdf?src-supplier=Element14; ComponentLink4Description: https://datasheet.ciiva.com/7849/1018594-7849966.pdf?src-supplier=Element14; ComponentLink5URL: https://datasheet.ciiva.com/15189/getdatasheetpartid-329253-15189431.pdf?src-supplier=Verical; ComponentLink5Description: https://datasheet.ciiva.com/15189/getdatasheetpartid-329253-15189431.pdf?src-supplier=Verical; ComponentLink6URL: https://datasheet.ciiva.com/17070/pyu-rc0402-51-rohs-l-6-r-17070335.pdf?src-supplier=Future+Electronics; ComponentLink6Description: https://datasheet.ciiva.com/17070/pyu-rc0402-51-rohs-l-6-r-17070335.pdf?src-supplier=Future+Electronics; Supplier Part Number 1: 603-RC0402FR-0733RL; LCSC Part Number: C138002
R403-R408 = CRA2512-FZ-R010ELF: RES 0.01 OHM 1% 3W 2512; Manufacturer: Bourns; Value: 10mR; Temperature Coefficient: 75ppm/°C; Item Type: Resistor; Supplier: Rs; Supplier Part Number: 6934381P; Manufacturer Part Number: CRA2512-FZ-R010ELF; RoHS: No; Category: Chip SMD Resistors; Stock: 15000; Pricing: 50=0.49, 100=0.46, 250=0.428, 500=0.39 (GBP); Case/Package: 348Case; Pins: 2NUMBER; Case Code (Imperial): 2512; Case Code (Metric): 6432; Min Operating Temperature: -55°C; Max Operating Temperature: 170°C; Resistor Type: Metal Film; Power Rating: 3W; Resistance Tolerance: 1%; Packaging: 13Packaging; Tolerance: 1%; Width: 3.2mm; Height: 900um; ComponentLink1URL: http://www.farnell.com/datasheets/2253366.pdf?src-supplier=Farnell; ComponentLink1Description: http://www.farnell.com/datasheets/2253366.pdf?src-supplier=Farnell; ComponentLink2URL: https://www.bourns.com/docs/product-datasheets/cra.pdf?src-supplier=Digikey; ComponentLink2Description: https://www.bourns.com/docs/product-datasheets/cra.pdf?src-supplier=Digikey; ComponentLink3URL: https://datasheet.octopart.com/CRA2512-FZ-R010ELF-Bourns-datasheet-15983344.pdf?src-supplier=Element14; ComponentLink3Description: https://datasheet.octopart.com/CRA2512-FZ-R010ELF-Bourns-datasheet-15983344.pdf?src-supplier=Element14; ComponentLink4URL: http://www.farnell.com/datasheets/1849485.pdf?src-supplier=Newark; ComponentLink4Description: http://www.farnell.com/datasheets/1849485.pdf?src-supplier=Newark; ComponentLink5URL: https://datasheet.octopart.com/CRA2512-FZ-R010ELF-Bourns-datasheet-68301994.pdf?src-supplier=Newark; ComponentLink5Description: https://datasheet.octopart.com/CRA2512-FZ-R010ELF-Bourns-datasheet-68301994.pdf?src-supplier=Newark; ComponentLink6URL: http://www.farnell.com/datasheets/2253366.pdf?src-supplier=Newark; ComponentLink6Description: http://www.farnell.com/datasheets/2253366.pdf?src-supplier=Newark; LCSC Part Number: C840621
R409 R410 R420 = RC0402FR-070RL: RES 0 OHM JUMPER 1/16W 0402; Manufacturer: Yageo; Item Type: Resistors; Tolerance: 1%; Power Rating: 62.5mW; Voltage Rating: 50V; Temperature Coefficient: 200ppm/°C; Max Power Dissipation: 63mW; Supplier 1: Mouser; Manufacturer Part Number: RC0402FR-070RL; RoHS: Yes; Stock 1: 8556842; Pricing 1: 1=0.10000, 10=0.01400, 50=0.01400, 100=0.00600, 1000=0.00300, 5000=0.00200, 10000=0.00100 (USD); Mount: Surface Mount; Case/Package: 0402; Contact Plating: Tin,Matte; Case Code (Imperial): 0402; Case Code (Metric): 1005; Size Code: 0402; Min Operating Temperature: -55°C; Max Operating Temperature: 155°C; Resistance: 0R; Resistor Type: Thick Film; Packaging: Tape and Reel; Termination: SMD/SMT; Features: Moisture Resistant; Series: RC; Number of Terminations: 2; Length: 1mm; Width: 0.5mm; Height: 0.35mm; Radiation Hardening: No; Lead Free: Lead Free; RoHS Compliant: Yes; ComponentLink1URL: https://datasheet.ciiva.com/8896/pyu-rc0402-51-rohs-l-6-8896149.pdf?src-supplier=Avnet; ComponentLink1Description: https://datasheet.ciiva.com/8896/pyu-rc0402-51-rohs-l-6-8896149.pdf?src-supplier=Avnet; ComponentLink2URL: https://datasheet.ciiva.com/16790/pyu-rc0402-51-rohs-l-6-r-16790444.pdf?src-supplier=Future+Electronics; ComponentLink2Description: https://datasheet.ciiva.com/16790/pyu-rc0402-51-rohs-l-6-r-16790444.pdf?src-supplier=Future+Electronics; Supplier Part Number 1: 603-RC0402FR-070RL; LCSC Part Number: C106231
R411 = RC0603FR-07120RL: RES 120 OHM 1% 1/10W 0603; Manufacturer: Yageo; Temperature Coefficient: 100ppm/°C; Voltage Rating (DC): 50V; Power Rating: 100mW; Item Type: Resistor; Supplier 1: Digi-Key; Manufacturer Part Number: RC0603FR-07120RL; RoHS: Yes; Category: Chip SMD Resistors; Stock 1: 839061; Pricing 1: 1=0.10000, 10=0.02400, 100=0.00970, 1000=0.00436, 2500=0.00378 (USD); Case/Package: 0603; Number of Pins: 2; Case Code (Metric): 1608; Case Code (Imperial): 0603; Size Code: 0603; Min Operating Temperature: -55°C; Max Operating Temperature: 155°C; Resistance: 120R; Tolerance: 1%; Resistor Type: Thick Film; Packaging: Tape and Reel; Voltage Rating: 50V; Package Quantity: 1; Number of Terminations: 2; Termination: SMD/SMT; Max Power Dissipation: 100mW; Features: Moisture Resistant; Series: RC; Construction: Rectangular; Resistance Tolerance: 1%; Length: 1.6mm; Width: 0.031inch; Height: 0.022inch; Depth: 0.8mm; REACH SVHC: No SVHC; Lead Free: Lead Free; Military Standard: Not; RoHS Compliant: Yes; ComponentLink1URL: https://datasheet.ciiva.com/2553/pyu-r-int-thick-7-2553512.pdf?src-supplier=Digi-Key; ComponentLink1Description: https://datasheet.ciiva.com/2553/pyu-r-int-thick-7-2553512.pdf?src-supplier=Digi-Key; ComponentLink2URL: https://datasheet.ciiva.com/7746/443971-7746248.pdf?src-supplier=Element14; ComponentLink2Description: https://datasheet.ciiva.com/7746/443971-7746248.pdf?src-supplier=Element14; ComponentLink3URL: https://datasheet.ciiva.com/2553/pyu-r-int-thick-7-2553513.pdf?src-supplier=Digi-Key; ComponentLink3Description: https://datasheet.ciiva.com/2553/pyu-r-int-thick-7-2553513.pdf?src-supplier=Digi-Key; ComponentLink4URL: https://datasheet.ciiva.com/7746/443971-7746249.pdf?src-supplier=Element14; ComponentLink4Description: https://datasheet.ciiva.com/7746/443971-7746249.pdf?src-supplier=Element14; ComponentLink5URL: https://datasheet.ciiva.com/2553/pyu-r-int-thick-7-2553514.pdf?src-supplier=Digi-Key; ComponentLink5Description: https://datasheet.ciiva.com/2553/pyu-r-int-thick-7-2553514.pdf?src-supplier=Digi-Key; ComponentLink6URL: https://datasheet.ciiva.com/46395/443971-46395021.pdf?src-supplier=Element14; ComponentLink6Description: https://datasheet.ciiva.com/46395/443971-46395021.pdf?src-supplier=Element14; Supplier Part Number 1: 311-120HRCT-ND; LCSC Part Number: C114640
R412 R415-R417 R419 R421 R422 = RC0402FR-0710KL: RES 10K OHM 1% 1/16W 0402; Manufacturer: Yageo; Resistance: 10kR; Voltage Rating (DC): 50V; Temperature Coefficient: 100ppm/°C; Power Rating: 62.5mW; Max Power Dissipation: 63mW; Item Type: Resistor; Supplier 1: Mouser; Manufacturer Part Number: RC0402FR-0710KL; RoHS: Yes; Category: Chip SMD Resistors; Stock 1: 18648329; Pricing 1: 1=0.10000, 10=0.01400, 50=0.01400, 100=0.00500, 1000=0.00300, 10000=0.00200 (USD); Case/Package: 0402; Number of Pins: 2; Case Code (Imperial): 0402; Case Code (Metric): 1005; Min Operating Temperature: -55°C; Max Operating Temperature: 155°C; Resistor Type: Thick Film; Tolerance: 1%; Packaging: Tape and Reel; Voltage Rating: 50V; Termination: SMD/SMT; Working Voltage: 50V; Number of Terminations: 2; Features: Moisture Resistant; Series: RC; Resistance Tolerance: 1%; Construction: Rectangular; Length: 1mm; Width: 0.5mm; Height: 0.32mm; Depth: 0.5mm; Lead Pitch: 0.2mm; REACH SVHC: No SVHC; Lead Free: Lead Free; RoHS Compliant: Yes; Military Standard: Not; ComponentLink1URL: https://datasheet.ciiva.com/7660/38568-7660787.pdf?src-supplier=Element14; ComponentLink1Description: https://datasheet.ciiva.com/7660/38568-7660787.pdf?src-supplier=Element14; ComponentLink2URL: https://datasheet.ciiva.com/7849/1686128-7849814.pdf?src-supplier=Element14; ComponentLink2Description: https://datasheet.ciiva.com/7849/1686128-7849814.pdf?src-supplier=Element14; ComponentLink3URL: https://datasheet.ciiva.com/7983/1018594-7983486.pdf?src-supplier=Element14; ComponentLink3Description: https://datasheet.ciiva.com/7983/1018594-7983486.pdf?src-supplier=Element14; ComponentLink4URL: https://datasheet.ciiva.com/22747/1018594-22747512.pdf?src-supplier=Element14; ComponentLink4Description: https://datasheet.ciiva.com/22747/1018594-22747512.pdf?src-supplier=Element14; ComponentLink5URL: https://datasheet.ciiva.com/12667/pyu-rc0402-51-rohs-l-6-r-12667067.pdf?src-supplier=Mouser; ComponentLink5Description: https://datasheet.ciiva.com/12667/pyu-rc0402-51-rohs-l-6-r-12667067.pdf?src-supplier=Mouser; ComponentLink6URL: https://datasheet.ciiva.com/7849/1784430-7849813.pdf?src-supplier=Element14; ComponentLink6Description: https://datasheet.ciiva.com/7849/1784430-7849813.pdf?src-supplier=Element14; ComponentLink7URL: https://datasheet.ciiva.com/7849/1784430-7849815.pdf?src-supplier=Element14; ComponentLink7Description: https://datasheet.ciiva.com/7849/1784430-7849815.pdf?src-supplier=Element14; Supplier Part Number 1: 603-RC0402FR-0710KL; LCSC Part Number: C60490
R413 = RC0402FR-073R3L: RES 3.3 OHM 1% 1/16W 0402; Manufacturer: Yageo; Temperature Coefficient: 200ppm/°C; Power Rating: 63mW; Voltage Rating: 50V; Supplier 1: Mouser; Manufacturer Part Number: RC0402FR-073R3L; RoHS: Yes; Category: Chip SMD Resistors; Stock 1: 167510; Pricing 1: 1=0.10000, 10=0.02200, 50=0.02200, 100=0.00900, 1000=0.00400, 10000=0.00200 (USD); Case/Package: 0402; Contact Plating: Tin,Matte; Case Code (Imperial): 0402; Case Code (Metric): 1005; Size Code: 0402; Min Operating Temperature: -55°C; Max Operating Temperature: 155°C; Tolerance: 1%; Resistance: 3.3R; Resistor Type: Thick Film; Packaging: Tape and Reel; Termination: SMD/SMT; Voltage Rating (DC): 50V; Features: Moisture Resistant; Series: RC; Max Power Dissipation: 63mW; Number of Terminations: 2; Construction: Rectangular; Resistance Tolerance: 1%; Length: 1mm; Depth: 0.5mm; REACH SVHC: Unknown; Military Standard: Not; Lead Free: Lead Free; RoHS Compliant: Yes; ComponentLink1URL: https://datasheet.ciiva.com/7849/1018594-7849999.pdf?src-supplier=Element14; ComponentLink1Description: https://datasheet.ciiva.com/7849/1018594-7849999.pdf?src-supplier=Element14; ComponentLink2URL: https://datasheet.ciiva.com/8893/pyu-rc0402-51-rohs-l-6-8893711.pdf?src-supplier=Avnet; ComponentLink2Description: https://datasheet.ciiva.com/8893/pyu-rc0402-51-rohs-l-6-8893711.pdf?src-supplier=Avnet; Supplier Part Number 1: 603-RC0402FR-073R3L; LCSC Part Number: C137986
U17 = THVD1449DR: IC TRANSCEIVER HALF 1/1 8SOIC; Manufacturer: Texas Instruments; Supplier: Mouser; LCSC Part Number: C3235059; Manufacturer Part Number: THVD1449DR; RoHS: No; Item Type: IC; Stock: 7454; Pricing: 1=3.62, 10=2.51, 50=2.51, 100=2.27, 1000=2.02, 10000=1.95 (USD)